# Altium schematic sheet Power-Sheet.SchDoc (part 1 of 3)
size 420 x 297 mm; DocumentNumber: 2; SheetNumber: 2; SheetTotal: 3
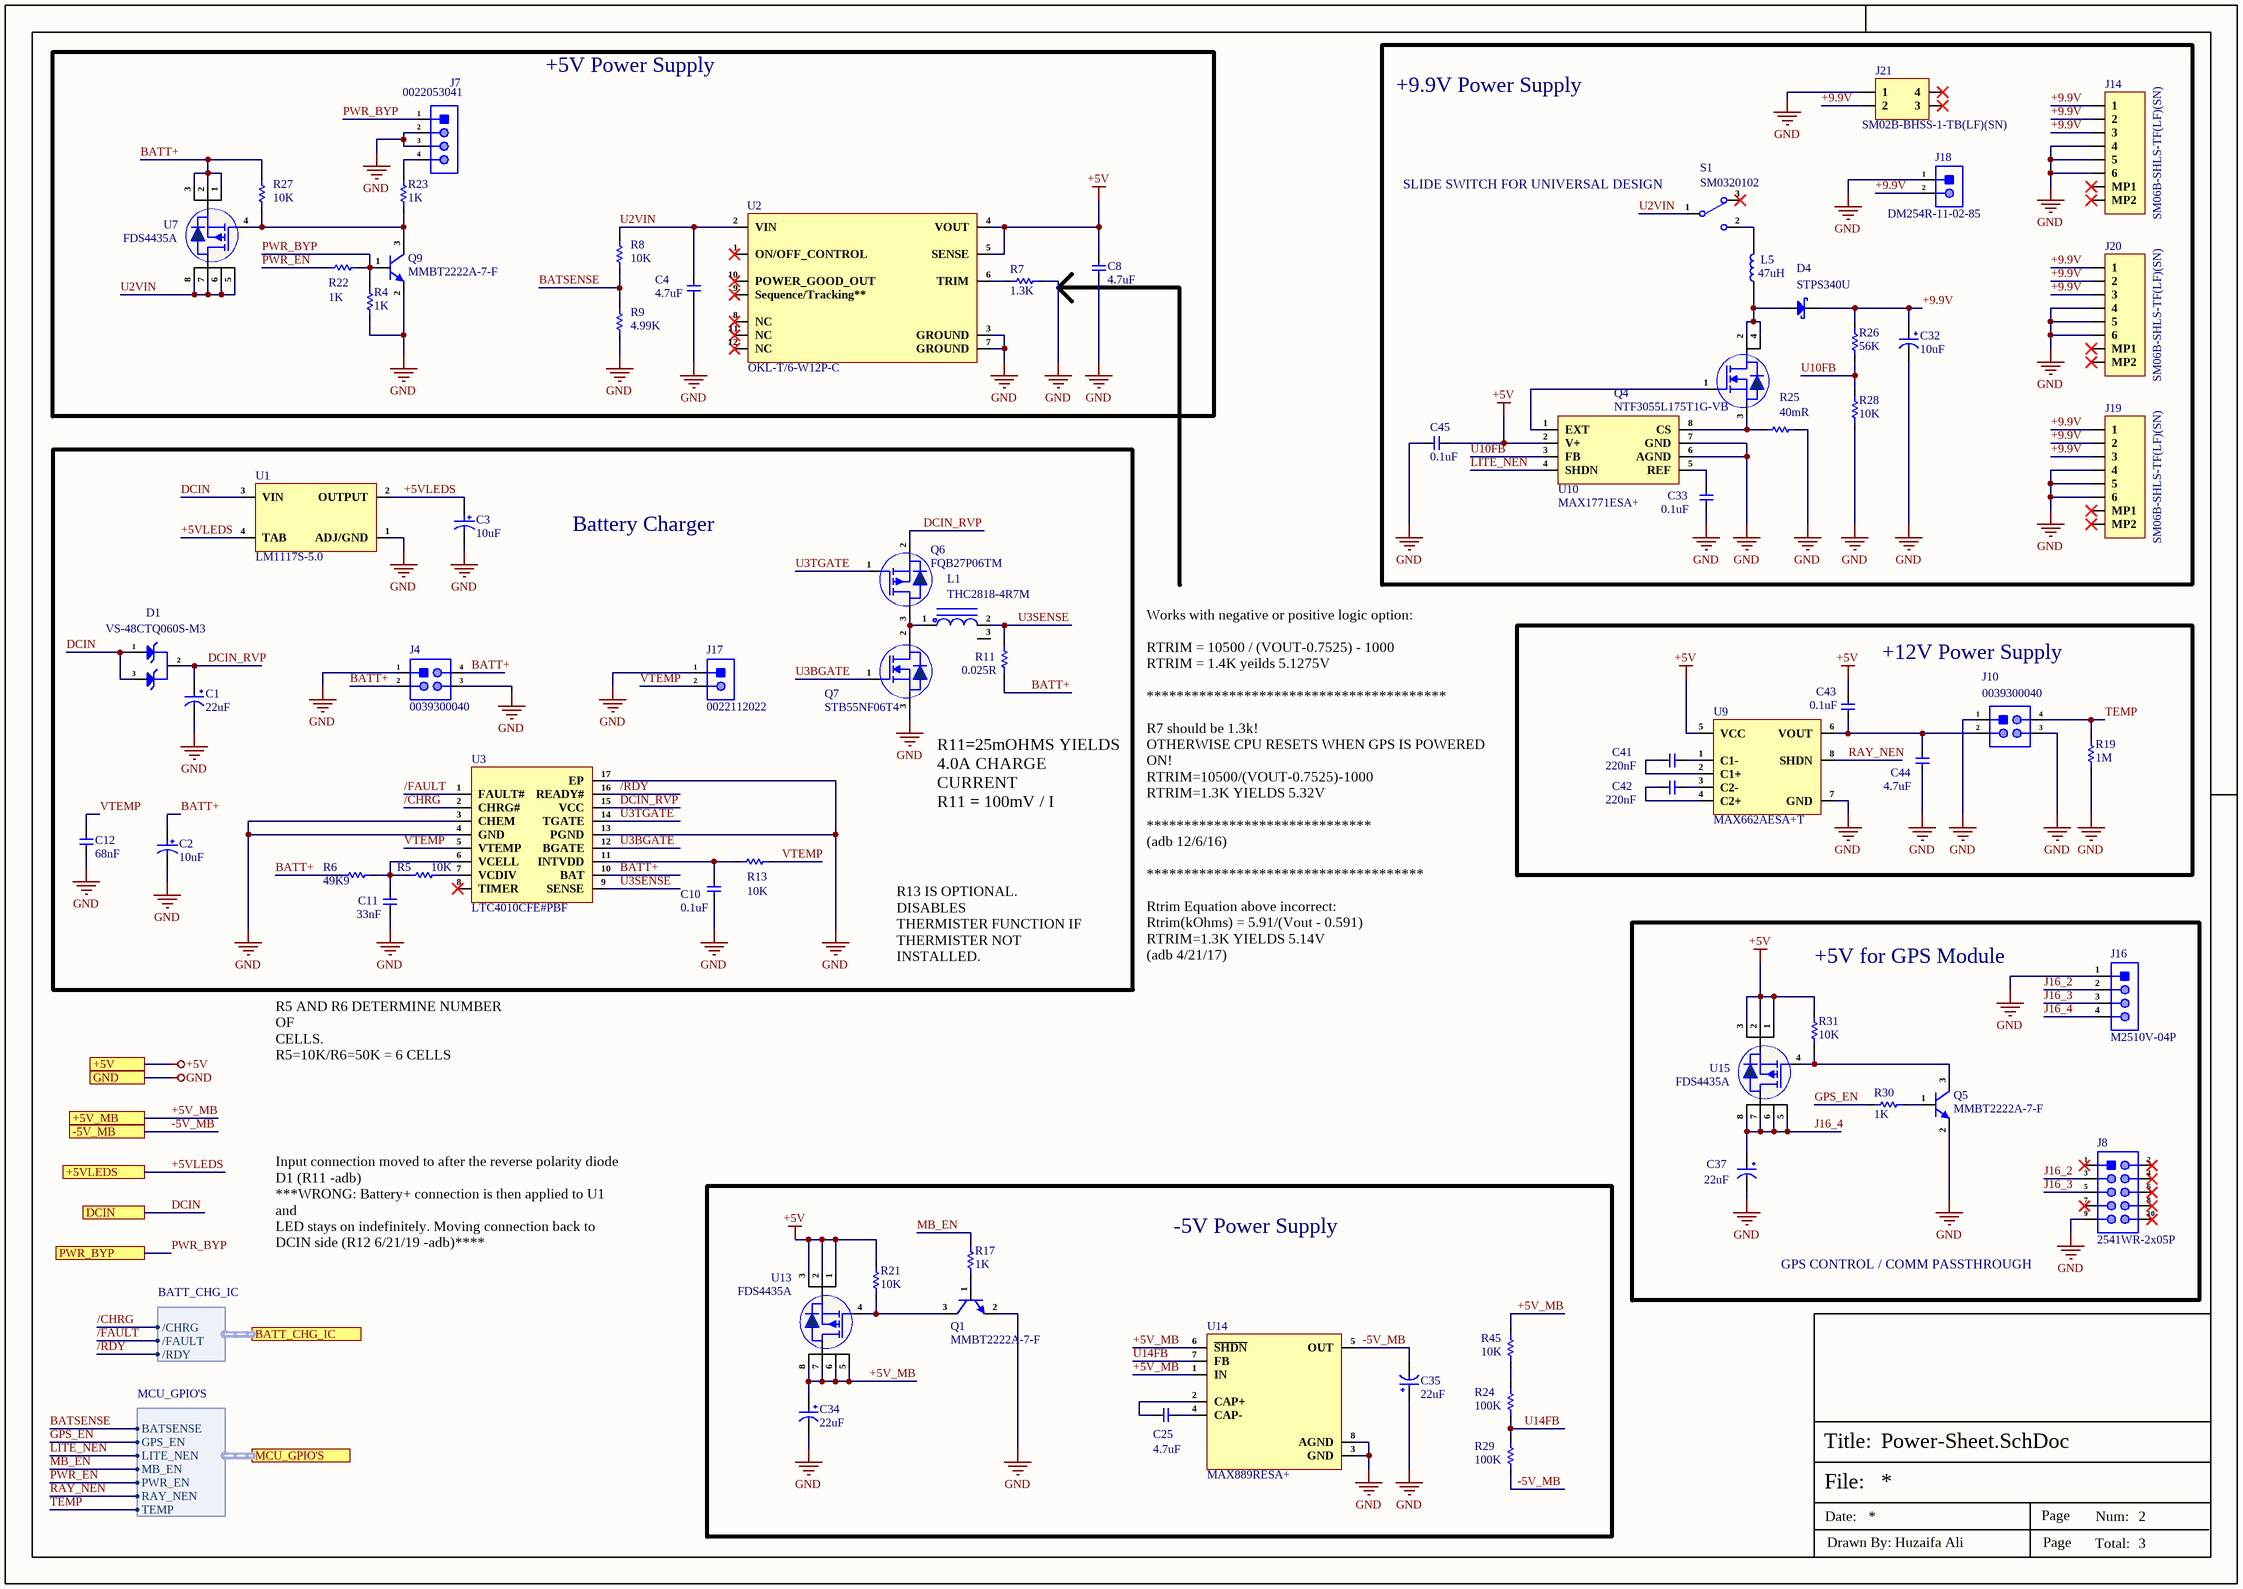
[diagram p0: Power-Sheet.SchDoc]

## Parts
C1  22uF  [Case-C]
C2  10uF  [Case-B]
C3  10uF  [Case-B]
C4  4.7uF  [Cap-0603]
C8  4.7uF  [Cap-0603]
C10  0.1uF  [Cap-0603]
C11  33nF  [Cap-0603]
C12  68nF  [Cap-0603]
C25  4.7uF  [Cap-0603]
C32  10uF  [Case-C]
C33  0.1uF  [Cap-0603]
C34  22uF  [Case-B]
C35  22uF  [Case-B]
C37  22uF  [Case-B]
C41  220nF  [Cap-0603]
C42  220nF  [Cap-0603]
C43  0.1uF  [Cap-0603]
C44  4.7uF  [Cap-0603]
C45  0.1uF  [Cap-0603]
D1  VS-48CTQ060S-M3  [VS-48CTQ060S-M3]
D4  STPS340U  [SMB_]
J4  0039300040  [0039300040]
J7  0022053041  [0022053041]
J8  2541WR-2x05P  [HDR 2x5TH (rigth angle)]
J10  0039300040  [0039300040]
J14  SM06B-SHLS-TF(LF)(SN)  [SM06B-SHLS-TF(LF)(SN)]
J16  M2510V-04P  [M2510V-04P]
J17  0022112022  [0022112022]
J18  DM254R-11-02-85  [HDR1X2 (Female)]
J19  SM06B-SHLS-TF(LF)(SN)  [SM06B-SHLS-TF(LF)(SN)]
J20  SM06B-SHLS-TF(LF)(SN)  [SM06B-SHLS-TF(LF)(SN)]
J21  SM02B-BHSS-1-TB(LF)(SN)  [SM02B-BHSS-1-TB(LF)(SN)]
L1  THC2818-4R7M  [THC2818-4R7M]
L5  47uH  [SMMS1050-470M]
Q1  MMBT2222A-7-F  [SOT-23]
Q4  NTF3055L175T1G-VB  [SOT- 223]
Q5  MMBT2222A-7-F  [SOT-23]
Q6  FQB27P06TM  [D2Pak.]
Q7  STB55NF06T4  [STB55NF06T4]
Q9  MMBT2222A-7-F  [SOT-23]
R4  1K  [Res-0603]
R5  10K  [Res-0603]
R6  49K9  [Res-0603]
R7  1.3K  [Res-0603]
R8  10K  [Res-0603]
R9  4.99K  [Res-0603]
R11  0.025R  [RES-2512]
R13  10K  [Res-0603]
R17  1K  [Res-0603]
R19  1M  [Res-0603]
R21  10K  [Res-0603]
R22  1K  [Res-0603]
R23  1K  [Res-0603]
R24  100K  [Res-0603]
R25  40mR  [Res-1206]
R26  56K  [Res-0603]
R27  10K  [Res-0603]
R28  10K  [Res-0603]
R29  100K  [Res-0603]
R30  1K  [Res-0603]
R31  10K  [Res-0603]
R45  10K  [Res-0603]
S1  SM0320102  [SM0320102]
U1  LM1117S-5.0  [SOT- 223]
U2  OKL-T/6-W12P-C  [OKL-T/6-W12P-C]  (value not drawn)
U3  LTC4010CFE#PBF  [TSSOP-16-EP]
U7  FDS4435A  [SOIC-8]
U9  MAX662AESA+T  [SOIC-8(0.154", 3.90mm Width)]
U10  MAX1771ESA+  [SOIC-8(0.150", 3.80mm Width)]
U13  FDS4435A  [SOIC-8]
U14  MAX889RESA+  [SOIC-8(0.154", 3.90mm Width)]
U15  FDS4435A  [SOIC-8]

## Blocks framed on the sheet
+5V Power Supply: C4 C8 J7 Q9 R4 R7-R9 R22 R23 R27 U2 U7
+9.9V Power Supply: C32 C33 C45 D4 J14 J18-J21 L5 Q4 R25 R26 R28 S1 U10
Battery Charger: C1-C3 C10-C12 D1 J4 J17 L1 Q6 Q7 R5 R6 R11 R13 U1 U3
+12V Power Supply: C41-C44 J10 R19 U9
+5V for GPS Module: C37 J8 J16 Q5 R30 R31 U15
-5V Power Supply: C25 C34 C35 Q1 R17 R21 R24 R29 R45 U13 U14

## Ports
+5V (see Top-Sheet[3B], Controller-Sheet[3C]), +5V_MB (see Top-Sheet[3B], Controller-Sheet[3C]), +5VLEDS (see Top-Sheet[3B], Controller-Sheet[3C]), -5V_MB (see Top-Sheet[3B], Controller-Sheet[3C]), BATT_CHG_IC (harness BATT_CHG_IC, see Top-Sheet[3C], Controller-Sheet[3D]), DCIN (see Top-Sheet[3C], Controller-Sheet[3D]), GND (see Top-Sheet[3B], Controller-Sheet[3C]), MCU_GPIO'S (harness MCU_GPIO'S, see Top-Sheet[3C], Controller-Sheet[3D]), PWR_BYP (see Top-Sheet[3C], Controller-Sheet[3D])

## Harnesses
MCU_GPIO'S: BATSENSE, GPS_EN, LITE_NEN, MB_EN, PWR_EN, RAY_NEN, TEMP
BATT_CHG_IC: /CHRG, /FAULT, /RDY

## Nets
+5V: C8.2 C43.2 C45.1 R21.2 R31.2 U2.4(VOUT) U2.5(SENSE) U9.5(VCC) U10.2(V+) U13.1(S) U13.2(S) U13.3(S) U15.1(S) U15.2(S) U15.3(S) ; port +5V
GND: C1.2 C2.2 C3.2 C4.1 C8.1 C10.1 C11.2 C12.1 C32.2 C33.1 C34.2 C35.1 C37.2 C44.1 C45.2 J4.1 J4.3 J7.2 J7.3 J8.9 J10.1 J10.3 J14.4 J14.5 J14.6 J16.1 J17.1 J18.1 J19.4 J19.5 J19.6 J20.4 J20.5 J20.6 J21.1 Q1.2(E) Q5.2(E) Q7.3(S) Q9.2(E) R4.2 R7.1 R9.1 R19.1 R25.1 R28.1 U1.1(ADJ/GND) U2.3(GROUND) U2.7(GROUND) U3.3(CHEM) U3.4(GND) U3.13(PGND) U3.17(EP) U9.7(GND) U10.6(AGND) U10.7(GND) U14.3(GND) U14.8(AGND) ; port GND
+5V_MB: C34.1 R45.2 U13.5(D) U13.6(D) U13.7(D) U13.8(D) U14.1(IN) U14.6(~{SHDN}) ; port +5V_MB
+5VLEDS: C3.1 U1.2(OUTPUT) U1.4(TAB) ; port +5VLEDS
+9.9V: C32.1 D4.2(K) J14.1 J14.2 J14.3 J18.2 J19.1 J19.2 J19.3 J20.1 J20.2 J20.3 J21.2 R26.2
-5V_MB: C35.2 R29.1 U14.5(OUT) ; port -5V_MB
/CHRG: U3.2(CHRG#) ; port BATT_CHG_IC./CHRG
/FAULT: U3.1(FAULT#) ; port BATT_CHG_IC./FAULT
/RDY: U3.16(READY#) ; port BATT_CHG_IC./RDY
BATSENSE: R8.2 R9.2 ; port MCU_GPIO'S.BATSENSE
BATT+: C2.1 J4.2 J4.4 R6.1 R11.1 R27.1 U3.10(BAT) U7.1(S) U7.2(S) U7.3(S)
DCIN: D1.1(ANODE) D1.3(ANODE) U1.3(VIN) ; port DCIN
DCIN_RVP: C1.1 D1.2(CATHODE) Q6.2(S) U3.15(VCC)
GPS_EN: R30.2 ; port MCU_GPIO'S.GPS_EN
J16_2: J8.3 J16.2
J16_3: J8.5 J16.3
J16_4: C37.1 J16.4 U15.5(D) U15.6(D) U15.7(D) U15.8(D)
LITE_NEN: U10.4(SHDN) ; port MCU_GPIO'S.LITE_NEN
MB_EN: R17.2 ; port MCU_GPIO'S.MB_EN
PWR_BYP: J7.1 Q9.1(B) R4.1 R22.1 ; port PWR_BYP
PWR_EN: R22.2 ; port MCU_GPIO'S.PWR_EN
RAY_NEN: U9.8(SHDN) ; port MCU_GPIO'S.RAY_NEN
TEMP: J10.4 R19.2 ; port MCU_GPIO'S.TEMP
U2VIN: C4.2 R8.1 S1.1 U2.2(VIN) U7.5(D) U7.6(D) U7.7(D) U7.8(D)
U3BGATE: Q7.1(G) U3.12(BGATE)
U3SENSE: L1.2 R11.2 U3.9(SENSE)
U3TGATE: Q6.1(G) U3.14(TGATE)
U10FB: R26.1 R28.2 U10.3(FB)
U14FB: R24.1 R29.2 U14.7(FB)
VTEMP: C12.2 J17.2 R13.2 U3.5(VTEMP)
NetC10_2: C10.2 R13.1 U3.11(INTVDD)
NetC11_1: C11.1 R5.1 R6.2 U3.6(VCELL)
NetC25_1: C25.1 U14.2(CAP+)
NetC25_2: C25.2 U14.4(CAP-)
NetC33_2: C33.2 U10.5(REF)
NetC41_1: C41.1 U9.2(C1+)
NetC41_2: C41.2 U9.1(C1-)
NetC42_1: C42.1 U9.4(C2+)
NetC42_2: C42.2 U9.3(C2-)
NetC43_1: C43.1 C44.2 J10.2 U9.6(VOUT)
NetD4_1: D4.1(A) L5.1 Q4.2(D) Q4.4(D)
NetJ7_4: J7.4 R23.1
NetL1_1: L1.1 Q6.3(D) Q7.2(D)
NetL5_2: L5.2 S1.2
NetQ1_1: Q1.1(B) R17.1
NetQ1_3: Q1.3(C) R21.1 U13.4(G)
NetQ4_1: Q4.1(G) U10.1(EXT)
NetQ4_3: Q4.3(S) R25.2 U10.8(CS)
NetQ5_1: Q5.1(B) R30.1
NetQ5_3: Q5.3(C) R31.1 U15.4(G)
NetQ9_3: Q9.3(C) R23.2 R27.2 U7.4(G)
NetR5_2: R5.2 U3.7(VCDIV)
NetR7_2: R7.2 U2.6(TRIM)
NetR24_2: R24.2 R45.1

Not connected (* = marked no-connect by the designer): J8 1* 2* 4* 6* 7* 8* 10*; J14 MP1* MP2*; J19 MP1* MP2*; J20 MP1* MP2*; J21 3* 4*; L1 3; S1 3*; U2 1(ON/OFF_CONTROL)* 8(NC)* 9(Sequence/Tracking**)* 10(POWER_GOOD_OUT)* 11(NC)* 12(NC)*; U3 8(TIMER)*

## Notes on the sheet
- SLIDE SWITCH FOR UNIVERSAL DESIGN
- R11=25mOHMS YIELDS 4.0A CHARGE CURRENT
  R11 = 100mV / I
- R13 IS OPTIONAL. DISABLES
  THERMISTER FUNCTION IF
  THERMISTER NOT INSTALLED.
  THERMISTER - 10K NTC / B=3750
- Works with negative or positive logic option:
  RTRIM = 10500 / (VOUT-0.7525) - 1000
  RTRIM = 1.4K yeilds 5.1275V
  ****************************************
  R7 should be 1.3k!
  OTHERWISE CPU RESETS WHEN GPS IS POWERED ON!
  RTRIM=10500/(VOUT-0.7525)-1000
  RTRIM=1.3K YIELDS 5.32V
  ******************************
  (adb 12/6/16)
  *************************************
  Rtrim Equation above incorrect:
  Rtrim(kOhms) = 5.91/(Vout - 0.591)
  RTRIM=1.3K YIELDS 5.14V
  (adb 4/21/17)
- R5 AND R6 DETERMINE NUMBER OF
  CELLS.
  R5=10K/R6=50K = 6 CELLS
- GPS CONTROL / COMM PASSTHROUGH
- Input connection moved to after the reverse polarity diode D1 (R11 -adb)
  ***WRONG: Battery+ connection is then applied to U1 and
  LED stays on indefinitely. Moving connection back to DCIN side (R12 6/21/19 -adb)****
- File:
- Title:
- Date:
- Page
- Num:
- Total:
- Drawn By: Huzaifa Ali